# Altium schematic sheet NFC_READER_MOS.SchDoc
size 330 x 220 mm; SheetNumber: 1; SheetTotal: 1
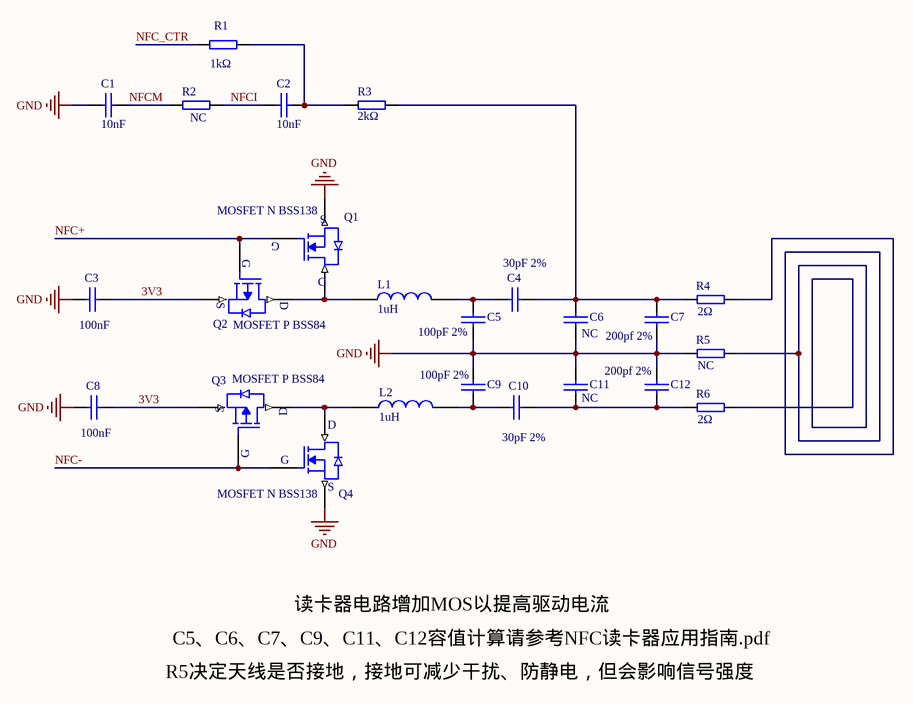
[diagram p0: NFC_READER_MOS.SchDoc]

## Parts
C1  10nF  [0402_C]
C2  10nF  [0402_C]
C3  100nF  [0402_C]
C4  30pF 2%  [0402_C]
C5  100pF 2%  [0402_C]
C6  NC  [0402_C]
C7  200pf 2%  [0402_C]
C8  100nF  [0402_C]
C9  100pF 2%  [0402_C]
C10  30pF 2%  [0402_C]
C11  NC  [0402_C]
C12  200pf 2%  [0402_C]
L1  1uH  [0603]
L2  1uH  [0603]
Q1  MOSFET N BSS138  [SOT-23]
Q2  MOSFET P BSS84  [SOT-23]
Q3  MOSFET P BSS84  [SOT-23]
Q4  MOSFET N BSS138  [SOT-23]
R1  1kΩ  [0402]
R2  NC  [0402]
R3  2kΩ  [0402]
R4  2Ω  [0402]
R5  NC  [0402]
R6  2Ω  [0402]

## Nets
GND: C1.2 C3.2 C5.1 C6.1 C7.1 C8.2 C9.2 C11.2 C12.2 Q1.2(S) Q4.2(S) R5.1
3V3: C3.1 C8.1 Q2.2(S) Q3.2(S)
NFC+: Q1.1(G) Q2.1(G)
NFC-: Q3.1(G) Q4.1(G)
NFC_CTR: R1.2
NFCI: C2.1 R2.1
NFCM: C1.1 R2.2
NetC2_2: C2.2 R1.1 R3.2
NetC4_1: C4.1 C5.2 L1.2
NetC4_2: C4.2 C6.2 C7.2 R3.1 R4.1
NetC9_1: C9.1 C10.1 L2.2
NetC10_2: C10.2 C11.1 C12.1 R6.1
NetL1_1: L1.1 Q1.3(D) Q2.3(D)
NetL2_1: L2.1 Q3.3(D) Q4.3(D)
NetR4_2: R4.2 R5.2 R6.2

## Notes on the sheet
- 读卡器电路增加MOS以提高驱动电流
- R5决定天线是否接地，接地可减少干扰、防静电，但会影响信号强度
- C5、C6、C7、C9、C11、C12容值计算请参考NFC读卡器应用指南.pdf

## Library data of the parts
C1-C12 = CAP: Capacitor
L1 L2 = INDUCTOR
Q1 Q4 = MOSFET N
Q2 Q3 = MOSFET P
R1-R6 = RES